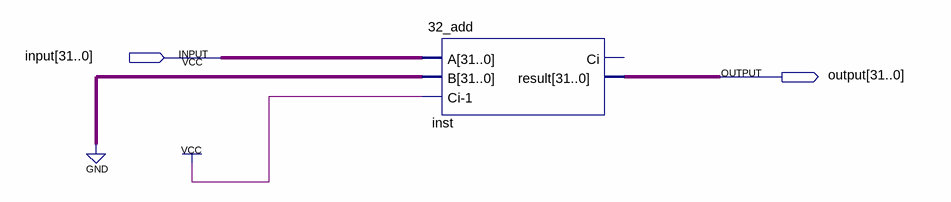
[diagram p0: schematic sheet]
// Quartus schematic ADD1.bdf as structural Verilog: 1 symbols, 2 pins
module ADD1 (
  input  [31:0] \input ,
  output [31:0] \output 
);

  \32_add  inst (.A(\input ), .B({32{1'b0}}), .\Ci-1 (1'b1), .result(\output ));  // open: Ci
endmodule
